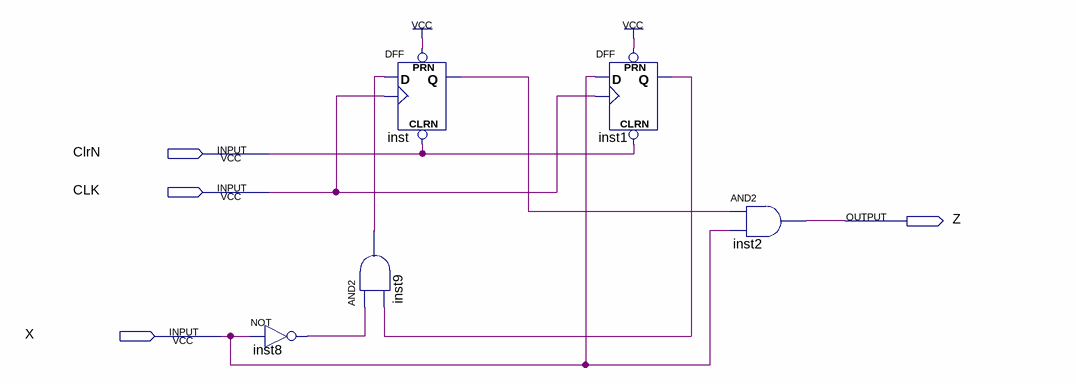
[diagram p0: schematic sheet]
// Quartus schematic Seq_detector.bdf as structural Verilog: 5 symbols, 4 pins
module Seq_detector (
  input  ClrN,
  input  CLK,
  input  X,
  output Z
);

  wire inst1_q, inst8_out, inst9_out, inst_q;

  not inst8 (inst8_out, X);
  and inst9 (inst9_out, inst8_out, inst1_q);
  DFF inst (.CLRN(ClrN), .CLK(CLK), .D(inst9_out), .PRN(1'b1), .Q(inst_q));
  DFF inst1 (.CLRN(ClrN), .CLK(CLK), .D(X), .PRN(1'b1), .Q(inst1_q));
  and inst2 (Z, inst_q, X);
endmodule
